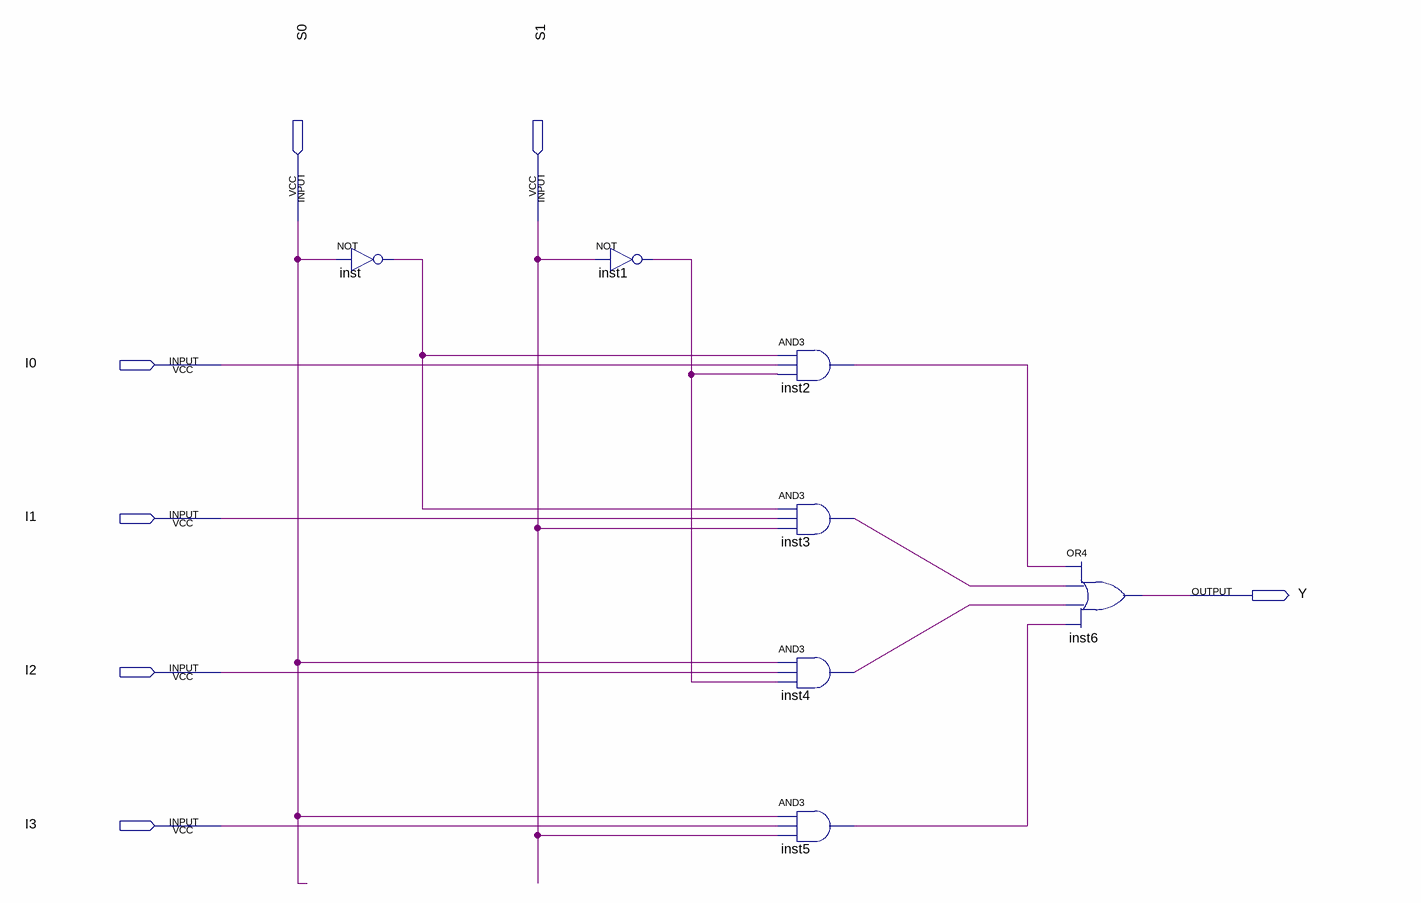
[diagram p0: schematic sheet]
// Quartus schematic 2bitselector.bdf as structural Verilog: 7 symbols, 7 pins
module \2bitselector  (
  input  S0,
  input  S1,
  input  I0,
  input  I1,
  input  I2,
  input  I3,
  output Y
);

  wire inst1_out, inst2_out, inst3_out, inst4_out, inst5_out, inst_out;

  not inst (inst_out, S0);
  not inst1 (inst1_out, S1);
  and inst2 (inst2_out, inst_out, I0, inst1_out);
  and inst3 (inst3_out, inst_out, I1, S1);
  and inst4 (inst4_out, S0, I2, inst1_out);
  and inst5 (inst5_out, S0, I3, S1);
  or inst6 (Y, inst2_out, inst3_out, inst4_out, inst5_out);
endmodule
